# Altium schematic sheet Mem_IS43TR16256A.SchDoc
size 594 x 420 mm; SheetNumber: 9; SheetTotal: 9
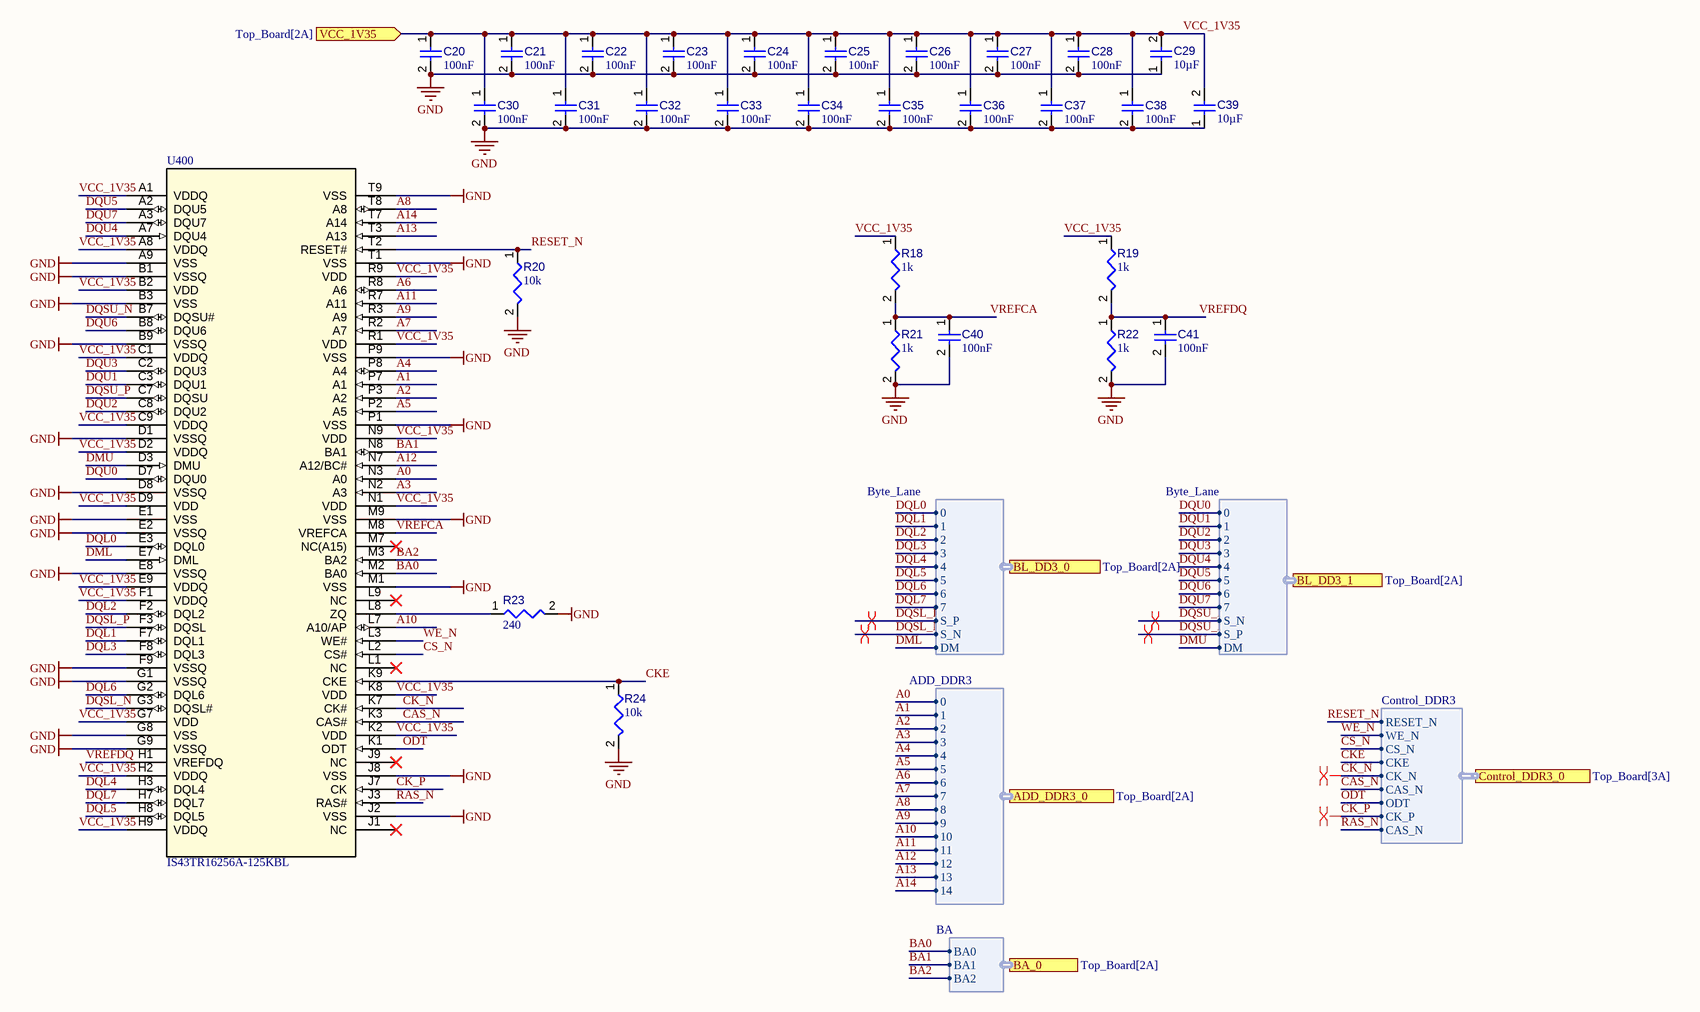
[diagram p0: Mem_IS43TR16256A.SchDoc]

## Parts
C20  value 100nF  [CAPC0402(1005)60_L]  (hidden comment: Capacitor 100nF +/-20% 50V 0402)
C21  value 100nF  [CAPC0402(1005)60_L]  (hidden comment: Capacitor 100nF +/-20% 50V 0402)
C22  value 100nF  [CAPC0402(1005)60_L]  (hidden comment: Capacitor 100nF +/-20% 50V 0402)
C23  value 100nF  [CAPC0402(1005)60_L]  (hidden comment: Capacitor 100nF +/-20% 50V 0402)
C24  value 100nF  [CAPC0402(1005)60_L]  (hidden comment: Capacitor 100nF +/-20% 50V 0402)
C25  value 100nF  [CAPC0402(1005)60_L]  (hidden comment: Capacitor 100nF +/-20% 50V 0402)
C26  value 100nF  [CAPC0402(1005)60_L]  (hidden comment: Capacitor 100nF +/-20% 50V 0402)
C27  value 100nF  [CAPC0402(1005)60_L]  (hidden comment: Capacitor 100nF +/-20% 50V 0402)
C28  value 100nF  [CAPC0402(1005)60_L]  (hidden comment: Capacitor 100nF +/-20% 50V 0402)
C29  value 10µF  [CAPC0805(2012)145_L]  (hidden comment: Capacitor 10µF +/-20% 25V 0805)
C30  value 100nF  [CAPC0402(1005)60_L]  (hidden comment: Capacitor 100nF +/-20% 50V 0402)
C31  value 100nF  [CAPC0402(1005)60_L]  (hidden comment: Capacitor 100nF +/-20% 50V 0402)
C32  value 100nF  [CAPC0402(1005)60_L]  (hidden comment: Capacitor 100nF +/-20% 50V 0402)
C33  value 100nF  [CAPC0402(1005)60_L]  (hidden comment: Capacitor 100nF +/-20% 50V 0402)
C34  value 100nF  [CAPC0402(1005)60_L]  (hidden comment: Capacitor 100nF +/-20% 50V 0402)
C35  value 100nF  [CAPC0402(1005)60_L]  (hidden comment: Capacitor 100nF +/-20% 50V 0402)
C36  value 100nF  [CAPC0402(1005)60_L]  (hidden comment: Capacitor 100nF +/-20% 50V 0402)
C37  value 100nF  [CAPC0402(1005)60_L]  (hidden comment: Capacitor 100nF +/-20% 50V 0402)
C38  value 100nF  [CAPC0402(1005)60_L]  (hidden comment: Capacitor 100nF +/-20% 50V 0402)
C39  value 10µF  [CAPC0805(2012)145_L]  (hidden comment: Capacitor 10µF +/-20% 25V 0805)
C40  value 100nF  [CAPC0402(1005)60_L]  (hidden comment: Capacitor 100nF +/-20% 50V 0402)
C41  value 100nF  [CAPC0402(1005)60_L]  (hidden comment: Capacitor 100nF +/-20% 50V 0402)
R18  value 1k  [RESC0805(2012)_L]  (hidden comment: Resistor 1K +/-5% 0805 125 mW)
R19  value 1k  [RESC0805(2012)_L]  (hidden comment: Resistor 1K +/-5% 0805 125 mW)
R20  value 10k  [RESC2013X50X35ML15T15]  (hidden comment: Resistor 10k +/-1% 0805 125 mW)
R21  value 1k  [RESC0805(2012)_L]  (hidden comment: Resistor 1K +/-5% 0805 125 mW)
R22  value 1k  [RESC0805(2012)_L]  (hidden comment: Resistor 1K +/-5% 0805 125 mW)
R23  value 240  [RESC0402(1005)_L]  (hidden comment: 240R2J)
R24  value 10k  [RESC2013X50X35ML15T15]  (hidden comment: Resistor 10k +/-1% 0805 125 mW)
U400  IS43TR16256A-125KBL  [BGA96_IS43TR_ISI]

## Ports
ADD_DDR3_0 (harness ADD_DDR3, see Top_Board[2A]), BA_0 (harness BA, see Top_Board[2A]), BL_DD3_0 (harness Byte_Lane, see Top_Board[2A]), BL_DD3_1 (harness Byte_Lane, see Top_Board[2A]), Control_DDR3_0 (harness Control_DDR3, see Top_Board[3A]), VCC_1V35 (in, see Top_Board[2A])

## Harnesses
Byte_Lane: 0, 2, 3, 4, 7, 1, 6, S_P, S_N, 5, DM
Byte_Lane: 0, 1, 2, 3, 4, 5, 6, 7, S_N, S_P, DM
ADD_DDR3: 1, 2, 3, 4, 6, 5, 7, 8, 9, 11, 10, 12, 13, 0, 14
BA: BA0, BA1, BA2
Control_DDR3: RESET_N, WE_N, CS_N, CKE, CK_N, CAS_N, ODT, CK_P, CAS_N

## Nets
GND: C20.2 C21.2 C22.2 C23.2 C24.2 C25.2 C26.2 C27.2 C28.2 C29.1 C30.2 C31.2 C32.2 C33.2 C34.2 C35.2 C36.2 C37.2 C38.2 C39.1 C40.2 C41.2 R20.2 R21.2 R22.2 R23.2 R24.2 U400.A9(VSS) U400.B1(VSSQ) U400.B3(VSS) U400.B9(VSSQ) U400.D1(VSSQ) U400.D8(VSSQ) U400.E1(VSS) U400.E2(VSSQ) U400.E8(VSSQ) U400.F9(VSSQ) U400.G1(VSSQ) U400.G8(VSS) U400.G9(VSSQ) U400.J2(VSS) U400.J8(VSS) U400.M1(VSS) U400.M9(VSS) U400.P1(VSS) U400.P9(VSS) U400.T1(VSS) U400.T9(VSS)
A0: U400.N3(A0) ; port ADD_DDR3_0.0
A1: U400.P7(A1) ; port ADD_DDR3_0.1
A2: U400.P3(A2) ; port ADD_DDR3_0.2
A3: U400.N2(A3) ; port ADD_DDR3_0.3
A4: U400.P8(A4) ; port ADD_DDR3_0.4
A5: U400.P2(A5) ; port ADD_DDR3_0.5
A6: U400.R8(A6) ; port ADD_DDR3_0.6
A7: U400.R2(A7) ; port ADD_DDR3_0.7
A8: U400.T8(A8) ; port ADD_DDR3_0.8
A9: U400.R3(A9) ; port ADD_DDR3_0.9
A10: U400.L7(A10/AP) ; port ADD_DDR3_0.10
A11: U400.R7(A11) ; port ADD_DDR3_0.11
A12: U400.N7(A12/BC#) ; port ADD_DDR3_0.12
A13: U400.T3(A13) ; port ADD_DDR3_0.13
A14: U400.T7(A14) ; port ADD_DDR3_0.14
BA0: U400.M2(BA0) ; port BA_0.BA0
BA1: U400.N8(BA1) ; port BA_0.BA1
BA2: U400.M3(BA2) ; port BA_0.BA2
CAS_N: U400.J3(RAS#) U400.K3(CAS#) ; port Control_DDR3_0.CAS_N  [also labelled RAS_N]
CK_N: U400.K7(CK#) ; port Control_DDR3_0.CK_N
CK_P: U400.J7(CK) ; port Control_DDR3_0.CK_P
CKE: R24.1 U400.K9(CKE) ; port Control_DDR3_0.CKE
CS_N: U400.L2(CS#) ; port Control_DDR3_0.CS_N
DML: U400.E7(DML) ; port BL_DD3_0.DM
DMU: U400.D3(DMU) ; port BL_DD3_1.DM
DQL0: U400.E3(DQL0) ; port BL_DD3_0.0
DQL1: U400.F7(DQL1) ; port BL_DD3_0.1
DQL2: U400.F2(DQL2) ; port BL_DD3_0.2
DQL3: U400.F8(DQL3) ; port BL_DD3_0.3
DQL4: U400.H3(DQL4) ; port BL_DD3_0.4
DQL5: U400.H8(DQL5) ; port BL_DD3_0.5
DQL6: U400.G2(DQL6) ; port BL_DD3_0.6
DQL7: U400.H7(DQL7) ; port BL_DD3_0.7
DQSL_N: U400.G3(DQSL#) ; port BL_DD3_0.S_N
DQSL_P: U400.F3(DQSL) ; port BL_DD3_0.S_P
DQSU_N: U400.B7(DQSU#) ; port BL_DD3_1.S_P
DQSU_P: U400.C7(DQSU) ; port BL_DD3_1.S_N
DQU0: U400.D7(DQU0) ; port BL_DD3_1.0
DQU1: U400.C3(DQU1) ; port BL_DD3_1.1
DQU2: U400.C8(DQU2) ; port BL_DD3_1.2
DQU3: U400.C2(DQU3) ; port BL_DD3_1.3
DQU4: U400.A7(DQU4) ; port BL_DD3_1.4
DQU5: U400.A2(DQU5) ; port BL_DD3_1.5
DQU6: U400.B8(DQU6) ; port BL_DD3_1.6
DQU7: U400.A3(DQU7) ; port BL_DD3_1.7
ODT: U400.K1(ODT) ; port Control_DDR3_0.ODT
RESET_N: R20.1 U400.T2(RESET#) ; port Control_DDR3_0.RESET_N
VCC_1V35: C20.1 C21.1 C22.1 C23.1 C24.1 C25.1 C26.1 C27.1 C28.1 C29.2 C30.1 C31.1 C32.1 C33.1 C34.1 C35.1 C36.1 C37.1 C38.1 C39.2 R18.1 R19.1 U400.A1(VDDQ) U400.A8(VDDQ) U400.B2(VDD) U400.C1(VDDQ) U400.C9(VDDQ) U400.D2(VDDQ) U400.D9(VDD) U400.E9(VDDQ) U400.F1(VDDQ) U400.G7(VDD) U400.H2(VDDQ) U400.H9(VDDQ) U400.K2(VDD) U400.K8(VDD) U400.N1(VDD) U400.N9(VDD) U400.R1(VDD) U400.R9(VDD) ; port VCC_1V35
VREFCA: C40.1 R18.2 R21.1 U400.M8(VREFCA)
VREFDQ: C41.1 R19.2 R22.1 U400.H1(VREFDQ)
WE_N: U400.L3(WE#) ; port Control_DDR3_0.WE_N
NetR23_1: R23.1 U400.L8(ZQ)

Not connected (* = marked no-connect by the designer): U400 J1(NC)* J9(NC)* L1(NC)* L9(NC)* M7(NC(A15))*

## Layout directives
differential pair: CK_N, CK_P, DQSL_N, DQSL_P, DQSU_N, DQSU_P

## Notes on the sheet
- DWG NO:
- REV:
- THIS DOCUMENT AND THE DATA DISCLOSED HEREIN OR
- HEREWITH IS THE PROPERTY OF ALTIUM LIMITED AND MAY
- BE FREELY DISTRIBUTED IN WHOLE. NO RIGHTS ARE
- RESERVED OR EXPRESS OR IMPLIED WARANTEE GIVEN.
- REVISION
- DESCRIPTION
- DATE
- APPROVED
- ENG:
- APPROVALS
- PROJECT
- DSN:
- CHK:
- REFERENCE DOCUMENTS
- PROJECT REVISION:
- TITLE
- DOCUMENT REVISION:
- DESIGN ITEM:
- BOM:
- FAB DWG:
- PCB DWG:
- ASSY DWG:
- SCALE:
- A2
- SIZE
- CAGE CODE
- FILE NAME
- DWG NO.
- SHEET
- OF
- REV

## Library data of the parts
C20-C28 C30-C38 C40 C41 = CMP-001-00067-3: Chip Capacitor, 100nF +/-20%, 50V, 0402, Thickness 0.6 mm; Manufacturer: Murata; Manufacturer Part Number: GRM155R61H104JE14D; Manufacturer: TAIYO YUDEN; Manufacturer Part Number: UMK105B7104KV-FR; Manufacturer: TDK; Manufacturer Part Number: C1005X7R1H104K; Manufacturer: Yageo Group; Manufacturer Part Number: CC0402KRX7R9BB104; Manufacturer Part Number: C1005X6S1H104K050BB; Manufacturer Part Number: CC0402KRX5R9BB104; Manufacturer Part Number: C1005X7R1H104K050BB; Manufacturer Part Number: GRM155R71H104KE14D; Manufacturer: KYOCERA AVX; Manufacturer Part Number: 04025D104KAT2A; Manufacturer Part Number: GCM155L81E104KE02D; Manufacturer Part Number: C1005X5R1H104K; Tolerance: 10%; Min Operating Temperature: -55°C; Pins: 2; Case/Package: 0402; Max Operating Temperature: 85°C; Voltage Rating: 50V; Mounting Technology: SMT; Component Type: Capacitors
C29 C39 = CMP-001-00079-4: Chip Capacitor, 10µF +/-20%, 25V, 0805, Thickness 1.45 mm; Tolerance: 10%; Max Operating Temperature: 85°C; Case/Package: 0805; Voltage Rating: 25V; Min Operating Temperature: -55°C; Mounting Technology: SMT; Pins: 2
R18 R19 R21 R22 = CMP-009-00118-3: Chip Resistor, 1 kOhms, +/-5%, 125 mW, -55 to 155 degC, 0805; Manufacturer: Yageo Group; Manufacturer Part Number: RC0805JR-071KL; Tolerance: 5%; Power: 125mW; Case/Package: 0805; Pins: 2; Min Operating Temperature: -55°C; Max Operating Temperature: 155°C; Component Type: Resistors
R20 R24 = CMP-009-00018-5: Chip Resistor, 10 KOhm, +/- 1%, 125 mW, -55 to 155 degC, 0805 (2012 Metric); Power: 125mW; Voltage Rating: 150V; Tolerance: 1%; Pins: 2; Min Operating Temperature: -55°C; Case/Package: 0805; Max Operating Temperature: 155°C; RoHS Compliant: True; Mounting Technology: SM
R23 = CMP-009-00084-2: 240R 0.063W 5% 0402 (1005 Metric)  SMD; Power: 63mW; Pins: 2; Case/Package: 0402; Mounting Technology: SMT; Tolerance: 5%
U400 = CMP-024-000001-1: No Description Available; Manufacturer_Name: ISSI; Source: IS43TR16256A-125KBL.SchLib; Copyright: Copyright (C) 2026 Ultra Librarian. All rights reserved.; Type: Memory; Design Item ID: IS43TR16256A-125KBL; Manufacturer_Part_Number: IS43TR16256A-125KBL; RefDes: RefDes